# Altium schematic sheet 栅驱-逆变-采样.schdoc
size 432 x 297 mm; Symbol: Drawing-Symbol_A4; Company: 嘉立创EDA; Version: V1.0; Page Size: A4; @Project Name: V4.0整合版; @Update Date: 2026-07-27; @Create Date: 2026-07-27; Device: Drawing-Symbol_A4; @Board Name: Board1; @Page Name: P2; @Create Time: 21:21:39; @Page Count: 2; @Page No: 2; @Schematic Name: Schematic1; @Update Time: 21:21:39; @Assembly Variant: Basic; Border: 1; Title Block Position: 3; Size: A4; Width: 1700; Height: 1170; Region Start: 1; X Region Count: 6; Y Region Count: 4; Blade Width: 10; Title Block: 0
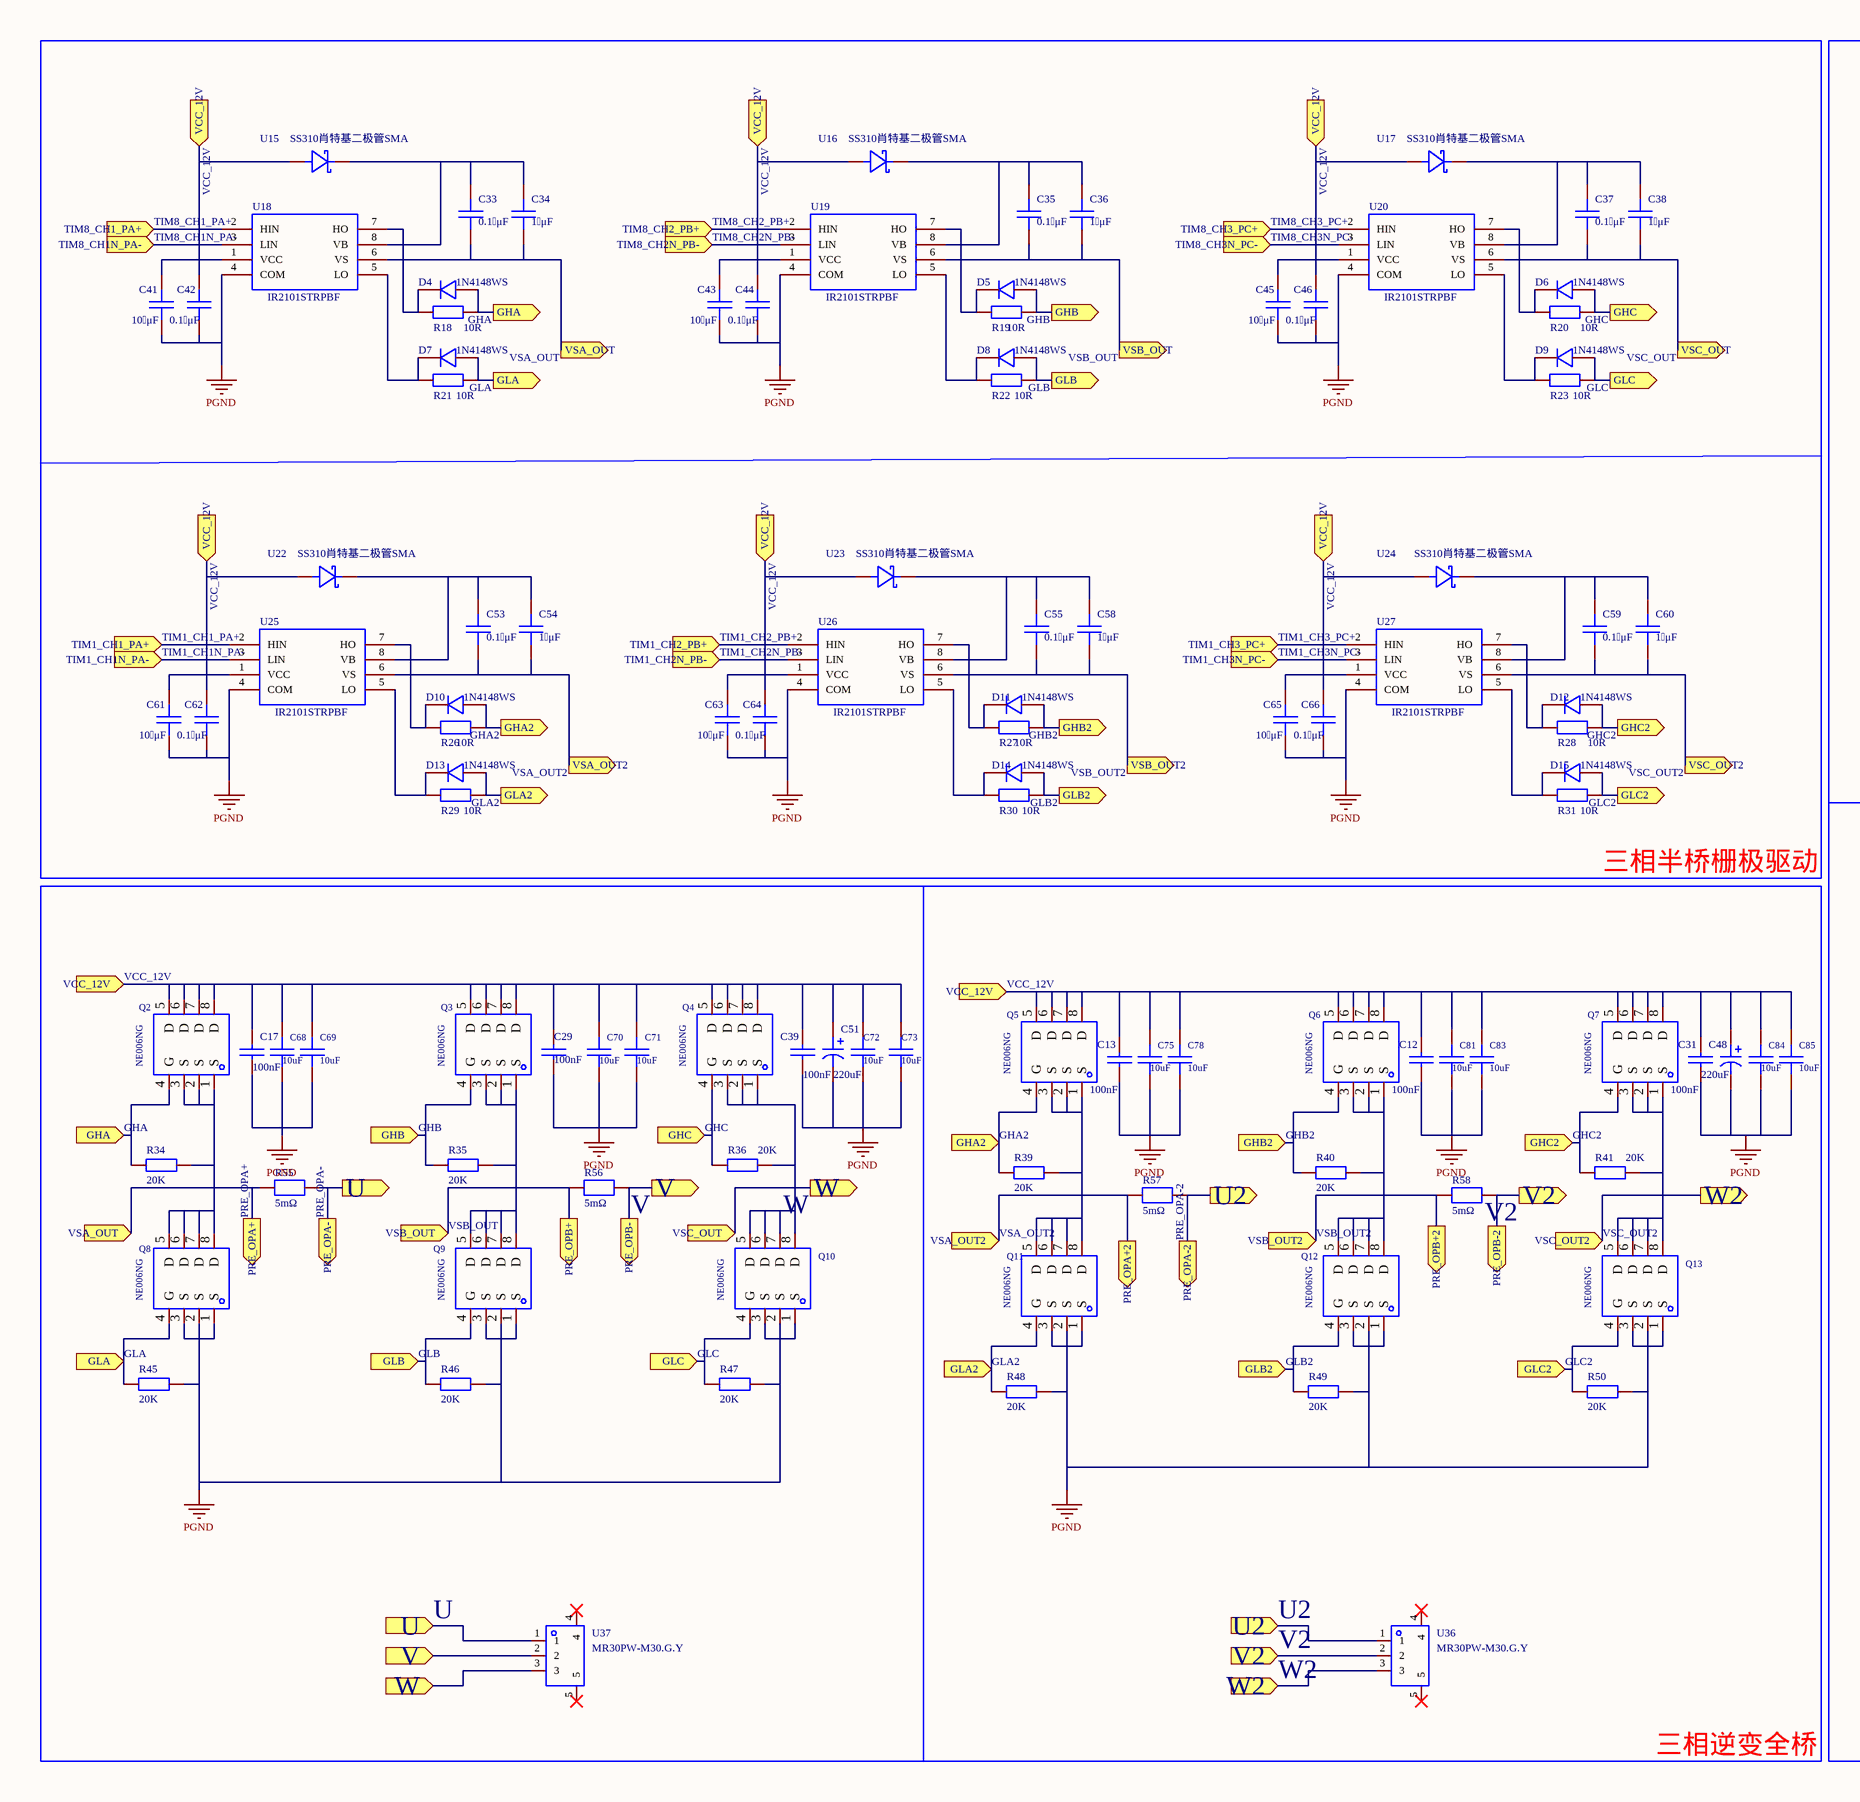
[diagram p0: 栅驱-逆变-采样.schdoc, left]
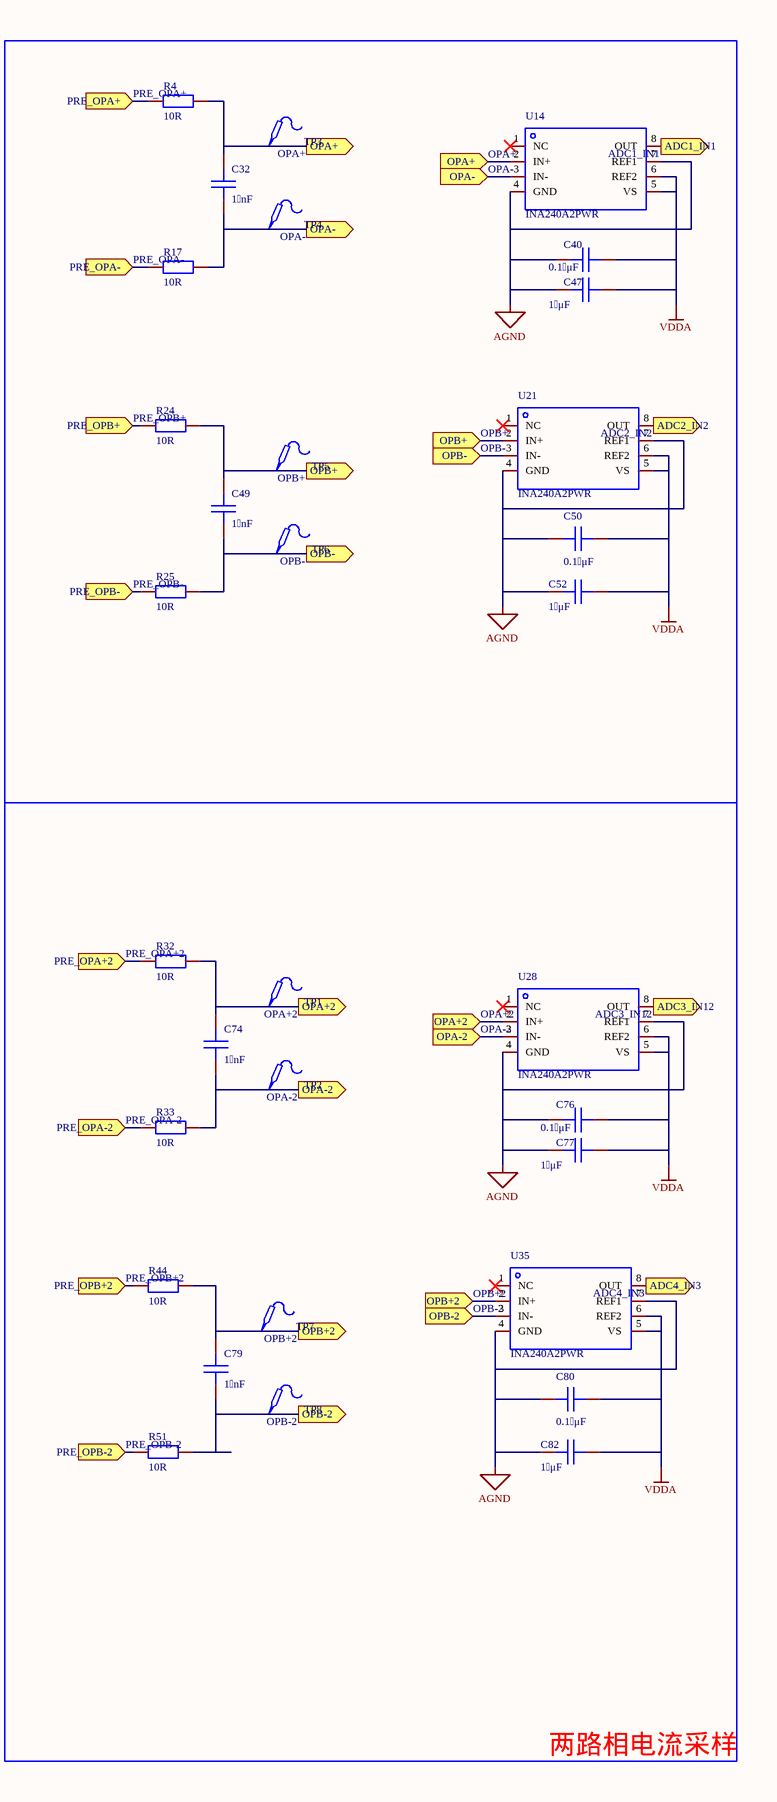
[diagram p1: 栅驱-逆变-采样.schdoc, right]

## Parts
C12  100nF  [C1206]
C13  100nF  [C1206]
C17  100nF  [C1206]
C29  100nF  [C1206]
C31  100nF  [C1206]
C32  1 nF  [C0603]
C33  0.1 μF  [C0603]
C34  1 μF  [C0603]
C35  0.1 μF  [C0603]
C36  1 μF  [C0603]
C37  0.1 μF  [C0603]
C38  1 μF  [C0603]
C39  100nF  [C1206]
C40  0.1 μF  [C0603]
C41  10 μF  [C0603]
C42  0.1 μF  [C0603]
C43  10 μF  [C0603]
C44  0.1 μF  [C0603]
C45  10 μF  [C0603]
C46  0.1 μF  [C0603]
C47  1 μF  [C0603]
C48  220uF  [CAP-SMD_BD6.3-L6.6-W6.6-FD]
C49  1 nF  [C0603]
C50  0.1 μF  [C0603]
C51  220uF  [CAP-SMD_BD6.3-L6.6-W6.6-FD]
C52  1 μF  [C0603]
C53  0.1 μF  [C0603]
C54  1 μF  [C0603]
C55  0.1 μF  [C0603]
C58  1 μF  [C0603]
C59  0.1 μF  [C0603]
C60  1 μF  [C0603]
C61  10 μF  [C0603]
C62  0.1 μF  [C0603]
C63  10 μF  [C0603]
C64  0.1 μF  [C0603]
C65  10 μF  [C0603]
C66  0.1 μF  [C0603]
C68  10uF  [C1206]
C69  10uF  [C1206]
C70  10uF  [C1206]
C71  10uF  [C1206]
C72  10uF  [C1206]
C73  10uF  [C1206]
C74  1 nF  [C0603]
C75  10uF  [C1206]
C76  0.1 μF  [C0603]
C77  1 μF  [C0603]
C78  10uF  [C1206]
C79  1 nF  [C0603]
C80  0.1 μF  [C0603]
C81  10uF  [C1206]
C82  1 μF  [C0603]
C83  10uF  [C1206]
C84  10uF  [C1206]
C85  10uF  [C1206]
D4  1N4148WS  [SOD-323_L1.8-W1.3-LS2.5-RD]
D5  1N4148WS  [SOD-323_L1.8-W1.3-LS2.5-RD]
D6  1N4148WS  [SOD-323_L1.8-W1.3-LS2.5-RD]
D7  1N4148WS  [SOD-323_L1.8-W1.3-LS2.5-RD]
D8  1N4148WS  [SOD-323_L1.8-W1.3-LS2.5-RD]
D9  1N4148WS  [SOD-323_L1.8-W1.3-LS2.5-RD]
D10  1N4148WS  [SOD-323_L1.8-W1.3-LS2.5-RD]
D11  1N4148WS  [SOD-323_L1.8-W1.3-LS2.5-RD]
D12  1N4148WS  [SOD-323_L1.8-W1.3-LS2.5-RD]
D13  1N4148WS  [SOD-323_L1.8-W1.3-LS2.5-RD]
D14  1N4148WS  [SOD-323_L1.8-W1.3-LS2.5-RD]
D15  1N4148WS  [SOD-323_L1.8-W1.3-LS2.5-RD]
Q2  NE006NG  [DFN5X6-8_L5.8-W5.0-P1.27-LS6.2-BL-EP]
Q3  NE006NG  [DFN5X6-8_L5.8-W5.0-P1.27-LS6.2-BL-EP]
Q4  NE006NG  [DFN5X6-8_L5.8-W5.0-P1.27-LS6.2-BL-EP]
Q5  NE006NG  [DFN5X6-8_L5.8-W5.0-P1.27-LS6.2-BL-EP]
Q6  NE006NG  [DFN5X6-8_L5.8-W5.0-P1.27-LS6.2-BL-EP]
Q7  NE006NG  [DFN5X6-8_L5.8-W5.0-P1.27-LS6.2-BL-EP]
Q8  NE006NG  [DFN5X6-8_L5.8-W5.0-P1.27-LS6.2-BL-EP]
Q9  NE006NG  [DFN5X6-8_L5.8-W5.0-P1.27-LS6.2-BL-EP]
Q10  NE006NG  [DFN5X6-8_L5.8-W5.0-P1.27-LS6.2-BL-EP]
Q11  NE006NG  [DFN5X6-8_L5.8-W5.0-P1.27-LS6.2-BL-EP]
Q12  NE006NG  [DFN5X6-8_L5.8-W5.0-P1.27-LS6.2-BL-EP]
Q13  NE006NG  [DFN5X6-8_L5.8-W5.0-P1.27-LS6.2-BL-EP]
R4  10R  [R0603]
R17  10R  [R0603]
R18  10R  [R0603]
R19  10R  [R0603]
R20  10R  [R0603]
R21  10R  [R0603]
R22  10R  [R0603]
R23  10R  [R0603]
R24  10R  [R0603]
R25  10R  [R0603]
R26  10R  [R0603]
R27  10R  [R0603]
R28  10R  [R0603]
R29  10R  [R0603]
R30  10R  [R0603]
R31  10R  [R0603]
R32  10R  [R0603]
R33  10R  [R0603]
R34  20K  [R0603]
R35  20K  [R0603]
R36  20K  [R0603]
R39  20K  [R0603]
R40  20K  [R0603]
R41  20K  [R0603]
R44  10R  [R0603]
R45  20K  [R0603]
R46  20K  [R0603]
R47  20K  [R0603]
R48  20K  [R0603]
R49  20K  [R0603]
R50  20K  [R0603]
R51  10R  [R0603]
R55  5mΩ  [R0612]
R56  5mΩ  [R0612]
R57  5mΩ  [R0612]
R58  5mΩ  [R0612]
TP1  (no value)  [Test-Point-0.5mm]
TP2  (no value)  [Test-Point-0.5mm]
TP3  (no value)  [Test-Point-0.5mm]
TP4  (no value)  [Test-Point-0.5mm]
TP5  (no value)  [Test-Point-0.5mm]
TP6  (no value)  [Test-Point-0.5mm]
TP7  (no value)  [Test-Point-0.5mm]
TP8  (no value)  [Test-Point-0.5mm]
U14  INA240A2PWR  [TSSOP-8_L4.4-W3.0-P0.65-LS6.4-BL]
U15  SS310肖特基二极管SMA  [SMA_L4.3-W2.6-LS5.1-R-RD]
U16  SS310肖特基二极管SMA  [SMA_L4.3-W2.6-LS5.1-R-RD]
U17  SS310肖特基二极管SMA  [SMA_L4.3-W2.6-LS5.1-R-RD]
U18  IR2101STRPBF  [SOIC-8_L5.0-W4.0-P1.27-LS6.0-BL]
U19  IR2101STRPBF  [SOIC-8_L5.0-W4.0-P1.27-LS6.0-BL]
U20  IR2101STRPBF  [SOIC-8_L5.0-W4.0-P1.27-LS6.0-BL]
U21  INA240A2PWR  [TSSOP-8_L4.4-W3.0-P0.65-LS6.4-BL]
U22  SS310肖特基二极管SMA  [SMA_L4.3-W2.6-LS5.1-R-RD]
U23  SS310肖特基二极管SMA  [SMA_L4.3-W2.6-LS5.1-R-RD]
U24  SS310肖特基二极管SMA  [SMA_L4.3-W2.6-LS5.1-R-RD]
U25  IR2101STRPBF  [SOIC-8_L5.0-W4.0-P1.27-LS6.0-BL]
U26  IR2101STRPBF  [SOIC-8_L5.0-W4.0-P1.27-LS6.0-BL]
U27  IR2101STRPBF  [SOIC-8_L5.0-W4.0-P1.27-LS6.0-BL]
U28  INA240A2PWR  [TSSOP-8_L4.4-W3.0-P0.65-LS6.4-BL]
U35  INA240A2PWR  [TSSOP-8_L4.4-W3.0-P0.65-LS6.4-BL]
U36  MR30PW-M30.G.Y  [CONN-TH_MR30PW-M30-G-Y]
U37  MR30PW-M30.G.Y  [CONN-TH_MR30PW-M30-G-Y]

## Blocks framed on the sheet
三相半桥栅极驱动: C33-C38 C41-C46 C53-C55 C58-C66 D4-D15 R18-R23 R26-R31 U15-U20 U22-U27
两路相电流采样: C32 C40 C47 C49 C50 C52 C74 C76 C77 C79 C80 C82 R4 R17 R24 R25 R32 R33 R44 R51 TP1-TP8 U14 U21 U28 U35
三相逆变全桥: C12 C13 C17 C29 C31 C39 C48 C51 C68-C73 C75 C78 C81 C83-C85 Q2-Q13 R34-R36 R39-R41 R45-R50 R55-R58 U36 U37

## Ports
ADC1_IN1 (out), ADC2_IN2 (out), ADC3_IN12 (out), ADC4_IN3 (out), GHA2 (in), GHA2 (out), GHA (in), GHA (out), GHB2 (in), GHB2 (out), GHB (in), GHB (out), GHC2 (in), GHC2 (out), GHC (in), GHC (out), GLA2 (in), GLA2 (out), GLA (in), GLA (out), GLB2 (in), GLB2 (out), GLB (in), GLB (out), GLC2 (in), GLC2 (out), GLC (in), GLC (out), OPA+2 (in), OPA+2 (out), OPA+ (in), OPA+ (out), OPA-2 (in), OPA-2 (out), OPA- (in), OPA- (out), OPB+2 (in), OPB+2 (out), OPB+ (in), OPB+ (out), OPB-2 (in), OPB-2 (out), OPB- (in), OPB- (out), PRE_OPA+2 (in), PRE_OPA+2 (out), PRE_OPA+ (in), PRE_OPA+ (out), PRE_OPA-2 (in), PRE_OPA-2 (out), PRE_OPA- (in), PRE_OPA- (out), PRE_OPB+2 (in), PRE_OPB+2 (out), PRE_OPB+ (in), PRE_OPB+ (out), PRE_OPB-2 (in), PRE_OPB-2 (out), PRE_OPB- (in), PRE_OPB- (out), TIM1_CH1_PA+ (in), TIM1_CH1N_PA- (in), TIM1_CH2_PB+ (in), TIM1_CH2N_PB- (in), TIM1_CH3_PC+ (in), TIM1_CH3N_PC- (in), TIM8_CH1_PA+ (in), TIM8_CH1N_PA- (in), TIM8_CH2_PB+ (in), TIM8_CH2N_PB- (in), TIM8_CH3_PC+ (in), TIM8_CH3N_PC- (in), U2 (in), U2 (out), U (in), U (out), V2 (in), V2 (out), V (in), V (out), VCC_12V (in), VSA_OUT2 (in), VSA_OUT2 (out), VSA_OUT (in), VSA_OUT (out), VSB_OUT2 (in), VSB_OUT2 (out), VSB_OUT (in), VSB_OUT (out), VSC_OUT2 (in), VSC_OUT2 (out), VSC_OUT (in), VSC_OUT (out), W2 (in), W2 (out), W (in), W (out)

## Nets
AGND: C40.2 C47.2 C50.2 C52.2 C76.2 C77.2 C80.2 C82.2 U14.4(GND) U14.7(REF1) U21.4(GND) U21.7(REF1) U28.4(GND) U28.7(REF1) U35.4(GND) U35.7(REF1)
PGND: C12.1 C13.1 C17.1 C29.1 C31.1 C39.1 C41.1 C42.1 C43.1 C44.1 C45.1 C46.1 C48.2 C51.2 C61.1 C62.1 C63.1 C64.1 C65.1 C66.1 C68.1 C69.1 C70.1 C71.1 C72.1 C73.1 C75.1 C78.1 C81.1 C83.1 C84.1 C85.1 Q8.1(S) Q8.2(S) Q8.3(S) Q9.1(S) Q9.2(S) Q9.3(S) Q10.1(S) Q10.2(S) Q10.3(S) Q11.1(S) Q11.2(S) Q11.3(S) Q12.1(S) Q12.2(S) Q12.3(S) Q13.1(S) Q13.2(S) Q13.3(S) R45.1 R46.1 R47.1 R48.1 R49.1 R50.1 U18.4(COM) U19.4(COM) U20.4(COM) U25.4(COM) U26.4(COM) U27.4(COM)
VDDA: C40.1 C47.1 C50.1 C52.1 C76.1 C77.1 C80.1 C82.1 U14.5(VS) U14.6(REF2) U21.5(VS) U21.6(REF2) U28.5(VS) U28.6(REF2) U35.5(VS) U35.6(REF2)
ADC1_IN1: U14.8(OUT) ; port ADC1_IN1
ADC2_IN2: U21.8(OUT) ; port ADC2_IN2
ADC3_IN12: U28.8(OUT) ; port ADC3_IN12
ADC4_IN3: U35.8(OUT) ; port ADC4_IN3
GHA: D4.2(A) Q2.4(G) R18.1 R34.2 ; port GHA
GHA2: D10.2(A) Q5.4(G) R26.1 R39.2 ; port GHA2
GHB: D5.2(A) Q3.4(G) R19.1 R35.2 ; port GHB
GHB2: D11.2(A) Q6.4(G) R27.1 R40.2 ; port GHB2
GHC: D6.2(A) Q4.4(G) R20.1 R36.2 ; port GHC
GHC2: D12.2(A) Q7.4(G) R28.1 R41.2 ; port GHC2
GLA: D7.2(A) Q8.4(G) R21.1 R45.2 ; port GLA
GLA2: D13.2(A) Q11.4(G) R29.1 R48.2 ; port GLA2
GLB: D8.2(A) Q9.4(G) R22.1 R46.2 ; port GLB
GLB2: D14.2(A) Q12.4(G) R30.1 R49.2 ; port GLB2
GLC: D9.2(A) Q10.4(G) R23.1 R47.2 ; port GLC
GLC2: D15.2(A) Q13.4(G) R31.1 R50.2 ; port GLC2
OPA+: C32.2 R4.1 TP3.1 U14.2(IN+) ; port OPA+
OPA+2: C74.2 R32.1 TP1.1 U28.2(IN+) ; port OPA+2
OPA-: C32.1 R17.1 TP4.1 U14.3(IN-) ; port OPA-
OPA-2: C74.1 R33.1 TP2.1 U28.3(IN-) ; port OPA-2
OPB+: C49.2 R24.1 TP5.1 U21.2(IN+) ; port OPB+
OPB+2: C79.2 R44.1 TP7.1 U35.2(IN+) ; port OPB+2
OPB-: C49.1 R25.1 TP6.1 U21.3(IN-) ; port OPB-
OPB-2: C79.1 R51.1 TP8.1 U35.3(IN-) ; port OPB-2
PRE_OPA+: C33.1 C34.1 Q2.1(S) Q2.2(S) Q2.3(S) Q8.5(D) Q8.6(D) Q8.7(D) Q8.8(D) R4.2 R34.1 R55.1 U18.6(VS) ; port VSA_OUT, port PRE_OPA+  [also labelled VSA_OUT]
PRE_OPA+2: C53.1 C54.1 Q5.1(S) Q5.2(S) Q5.3(S) Q11.5(D) Q11.6(D) Q11.7(D) Q11.8(D) R32.2 R39.1 R57.1 U25.6(VS) ; port VSA_OUT2, port PRE_OPA+2  [also labelled VSA_OUT2]
PRE_OPA-: R17.2 R55.2 U37.1 ; port U, port PRE_OPA-  [also labelled U]
PRE_OPA-2: R33.2 R57.2 U36.1 ; port U2, port PRE_OPA-2  [also labelled U2]
PRE_OPB+: C35.1 C36.1 Q3.1(S) Q3.2(S) Q3.3(S) Q9.5(D) Q9.6(D) Q9.7(D) Q9.8(D) R24.2 R35.1 R56.1 U19.6(VS) ; port VSB_OUT, port PRE_OPB+  [also labelled VSB_OUT]
PRE_OPB+2: C55.1 C58.1 Q6.1(S) Q6.2(S) Q6.3(S) Q12.5(D) Q12.6(D) Q12.7(D) Q12.8(D) R40.1 R44.2 R58.1 U26.6(VS) ; port VSB_OUT2, port PRE_OPB+2  [also labelled VSB_OUT2]
PRE_OPB-: R25.2 R56.2 U37.2 ; port V, port PRE_OPB-  [also labelled V]
PRE_OPB-2: R51.2 R58.2 U36.2 ; port V2, port PRE_OPB-2  [also labelled V2]
TIM1_CH1_PA+: U25.2(HIN) ; port TIM1_CH1_PA+
TIM1_CH1N_PA-: U25.3(LIN) ; port TIM1_CH1N_PA-
TIM1_CH2_PB+: U26.2(HIN) ; port TIM1_CH2_PB+
TIM1_CH2N_PB-: U26.3(LIN) ; port TIM1_CH2N_PB-
TIM1_CH3_PC+: U27.2(HIN) ; port TIM1_CH3_PC+
TIM1_CH3N_PC-: U27.3(LIN) ; port TIM1_CH3N_PC-
TIM8_CH1_PA+: U18.2(HIN) ; port TIM8_CH1_PA+
TIM8_CH1N_PA-: U18.3(LIN) ; port TIM8_CH1N_PA-
TIM8_CH2_PB+: U19.2(HIN) ; port TIM8_CH2_PB+
TIM8_CH2N_PB-: U19.3(LIN) ; port TIM8_CH2N_PB-
TIM8_CH3_PC+: U20.2(HIN) ; port TIM8_CH3_PC+
TIM8_CH3N_PC-: U20.3(LIN) ; port TIM8_CH3N_PC-
VCC_12V: C12.2 C13.2 C17.2 C29.2 C31.2 C39.2 C41.2 C42.2 C43.2 C44.2 C45.2 C46.2 C48.1 C51.1 C61.2 C62.2 C63.2 C64.2 C65.2 C66.2 C68.2 C69.2 C70.2 C71.2 C72.2 C73.2 C75.2 C78.2 C81.2 C83.2 C84.2 C85.2 Q2.5(D) Q2.6(D) Q2.7(D) Q2.8(D) Q3.5(D) Q3.6(D) Q3.7(D) Q3.8(D) Q4.5(D) Q4.6(D) Q4.7(D) Q4.8(D) Q5.5(D) Q5.6(D) Q5.7(D) Q5.8(D) Q6.5(D) Q6.6(D) Q6.7(D) Q6.8(D) Q7.5(D) Q7.6(D) Q7.7(D) Q7.8(D) U15.1(A) U16.1(A) U17.1(A) U18.1(VCC) U19.1(VCC) U20.1(VCC) U22.1(A) U23.1(A) U24.1(A) U25.1(VCC) U26.1(VCC) U27.1(VCC) ; port VCC_12V
VSC_OUT: C37.1 C38.1 Q4.1(S) Q4.2(S) Q4.3(S) Q10.5(D) Q10.6(D) Q10.7(D) Q10.8(D) R36.1 U20.6(VS) U37.3 ; port VSC_OUT, port W  [also labelled W]
VSC_OUT2: C59.1 C60.1 Q7.1(S) Q7.2(S) Q7.3(S) Q13.5(D) Q13.6(D) Q13.7(D) Q13.8(D) R41.1 U27.6(VS) U36.3 ; port VSC_OUT2, port W2  [also labelled W2]
NetC33_2: C33.2 C34.2 U15.2(K) U18.8(VB)
NetC35_2: C35.2 C36.2 U16.2(K) U19.8(VB)
NetC37_2: C37.2 C38.2 U17.2(K) U20.8(VB)
NetC53_2: C53.2 C54.2 U22.2(K) U25.8(VB)
NetC55_2: C55.2 C58.2 U23.2(K) U26.8(VB)
NetC59_2: C59.2 C60.2 U24.2(K) U27.8(VB)
NetD4_1: D4.1(K) R18.2 U18.7(HO)
NetD5_1: D5.1(K) R19.2 U19.7(HO)
NetD6_1: D6.1(K) R20.2 U20.7(HO)
NetD7_1: D7.1(K) R21.2 U18.5(LO)
NetD8_1: D8.1(K) R22.2 U19.5(LO)
NetD9_1: D9.1(K) R23.2 U20.5(LO)
NetD10_1: D10.1(K) R26.2 U25.7(HO)
NetD11_1: D11.1(K) R27.2 U26.7(HO)
NetD12_1: D12.1(K) R28.2 U27.7(HO)
NetD13_1: D13.1(K) R29.2 U25.5(LO)
NetD14_1: D14.1(K) R30.2 U26.5(LO)
NetD15_1: D15.1(K) R31.2 U27.5(LO)

Not connected (* = marked no-connect by the designer): U14 1(NC)*; U21 1(NC)*; U28 1(NC)*; U35 1(NC)*; U36 4* 5*; U37 4* 5*

## Notes on the sheet
- 创建日期
- 2026-07-27
- 原理图
- 板子
- Schematic1
- Board1
- 更新日期
- 图页
- P2
- 绘制
- 审阅
- V4.0整合版
- 版本
- V1.0
- 尺寸
- A4
- 页    2    共    2
- 嘉立创EDA

## Library data of the parts
C12 C13 C17 C29 C31 C39 = CL31B104KBCNNNC: 容值:100nF;精度:±10%;额定电压:50V;温度系数:X7R;; Manufacturer: SAMSUNG(三星); AddInBom: yes; ModelId: e4be705b945545a48e666415e3682bd80819f05c4eef4c71ace90d822a990e87; ModelName: C1206_L3.2-W1.6-H1.3; ModelTransform: 125.984,62.992,0,0,0,0,0,0,0; Tolerance: ±10%; Voltage Rating: 50V; Temperature Coefficient: X7R; Symbol: CL31B104KBCNNNC; Device: CL31B104KBCNNNC; LCSC Part Name: 100nF ±10% 50V; SupplierPart: C24497; ManufacturerPart: CL31B104KBCNNNC; Supplier Footprint: 1206; JLCPCB Part Class: Basic Part; Datasheet: https://item.szlcsc.com/datasheet/CL31B104KBCNNNC/25237.html; Supplier: LCSC; ConvertToPcb: yes; FootprintName: C1206; Value: 100nF
C32-C38 C40-C47 C49 C50 C52-C55 C58-C66 C74 C76 C77 C79 C80 C82 = CAP_0603: Symbol: Capacitance; 3D Model: ac125912035d415993ca9572d50418b10819f05c4eef4c71ace90d822a990e87; 3D Model Transform: 62.992,31.496,0,0,0,0,0,0,0; ConvertToPcb: yes; ModelName: C0603_L1.6-W0.8-H0.8; Device: CAP_0603; Supplier Footprint: 0603; AddInBom: yes; FootprintName: C0603
  C32 C49 C74 C79: Value: 1 nF
  C33 C35 C37 C40 C42 C44 C46 C50 C53 C55 C59 C62 C64 C66 C76 C80: Value: 0.1 μF
  C34 C36 C38 C47 C52 C54 C58 C60 C77 C82: Value: 1 μF
  C41 C43 C45 C61 C63 C65: Value: 10 μF
C48 C51 = JVJ35V220M6x8: 容值:220uF;精度:±20%;额定电压:35V;纹波电流:190mA@120Hz;; Manufacturer: JIERR(捷而瑞); AddInBom: yes; ModelId: ec7f1c7bda5e4386b54ec5ff3d1d94ff0819f05c4eef4c71ace90d822a990e87; ModelTransform: 307.086,259.842,0,180,0,0,0,0,0; Tolerance: ±20%; Voltage Rating: 35V; Lifetime: 2000hrs@105℃; Symbol: JVJ35V220M6X8; Device: JVJ35V220M6x8; LCSC Part Name: 220uF ±20% 35V; SupplierPart: C46550411; ManufacturerPart: JVJ35V220M6x8; Supplier Footprint: SMD,D6.3xL7.7mm; JLCPCB Part Class: Extended Part; Datasheet: https://item.szlcsc.com/datasheet/JVJ35V220M6x8/48680105.html; Supplier: LCSC; ConvertToPcb: yes; FootprintName: CAP-SMD_BD6.3-L6.6-W6.6-FD; ModelName: CAP-SMD_BD6.3-L6.6-W6.6-FD; Value: 220uF; Ripple Current: 190mA@120Hz; Diameter: 6.3mm; Height - Seated (Max): 7.7mm; Operating Temperature: -55℃~+105℃
C68-C73 C75 C78 C81 C83-C85 = HGC1206R5106M500NSPJ: 容值:10uF;精度:±20%;额定电压:50V;温度系数:X5R;; Manufacturer: Chinocera(华瓷); AddInBom: yes; ModelId: e4be705b945545a48e666415e3682bd80819f05c4eef4c71ace90d822a990e87; ModelName: C1206_L3.2-W1.6-H1.3; ModelTransform: 125.984,62.992,0,0,0,0,0,0,0; Tolerance: ±20%; Voltage Rating: 50V; Temperature Coefficient: X5R; Symbol: HGC1206R5106M500NSPJ; Device: HGC1206R5106M500NSPJ; LCSC Part Name: 10uF ±20% 50V; SupplierPart: C7432782; ManufacturerPart: HGC1206R5106M500NSPJ; Supplier Footprint: 1206; JLCPCB Part Class: Extended Part; Datasheet: https://item.szlcsc.com/datasheet/HGC1206R5106M500NSPJ/8438264.html; Supplier: LCSC; ConvertToPcb: yes; FootprintName: C1206; Value: 10uF
D4-D15 = 1N4148WS_C2128: 二极管配置:独立式;整流电流:150mA;直流反向耐压(Vr):100V;正向压降(Vf):1.25V@150mA;反向恢复时间(Trr):4ns;; Manufacturer: CJ(江苏长电/长晶); Symbol: 1N4148WS T4; 3D Model: db63db13d9e342eb939127d413d6200b0819f05c4eef4c71ace90d822a990e87; 3D Model Transform: 104.3305,51.181,0,0,0,0,0,-0.004,0; Diode Configuration: 独立式; Pd - Power Dissipation: 200mW; Current - Rectified: 150mA; Voltage - DC Reverse(Vr): 100V; Non-Repetitive Peak Forward Surge Current: 2A; Reverse Leakage Current (Ir): 1uA@75V; Reverse Recovery Time (trr): 4ns; AddInBom: yes; Device: 1N4148WS_C2128; LCSC Part Name: 丝印T4 100V 150mA; Supplier Part: C2128; Manufacturer Part: 1N4148WS; Supplier Footprint: SOD-323; JLCPCB Part Class: Basic Part; Datasheet: https://item.szlcsc.com/datasheet/1N4148WS/2485.html; Supplier: LCSC; Voltage - Forward(Vf@If): 1.25V@150mA; Operating Junction Temperature Range: -; ConvertToPcb: yes; FootprintName: SOD-323_L1.8-W1.3-LS2.5-RD; ModelName: SOD-323_L1.8-W1.3-LS2.5-RD
Q2-Q13 = NE006NG: 数量:1个N沟道;漏源电压(Vdss):60V;连续漏极电流(Id):70A;导通电阻(RDS(on)):4.6mΩ@10V;耗散功率(Pd):84W;阈值电压(Vgs(th)):2.7V;; Manufacturer: DOINGTER(杜因特); 3D Model: 82d86f10988147ef9b82700d9bd42f650819f05c4eef4c71ace90d822a990e87; 3D Model Transform: 200.787,239.17275,0,0,0,0,0.002,-0.004,0; Number: 1个N沟道; Drain to Source Voltage: 60V; Current - Continuous Drain(Id): 70A; Pd - Power Dissipation: 84W; Gate Threshold Voltage (Vgs(th)): 2.7V; Gate Charge(Qg): 90nC@10V; Input Capacitance(Ciss): 4nF; Reverse Transfer Capacitance (Crss@Vds): 252pF; Type: N沟道; Output Capacitance(Coss): 309pF; AddInBom: yes; Symbol: NE006NG; Device: NE006NG; LCSC Part Name: N沟道MOSFET采用先进沟槽技术，具备低栅极电荷和出色散热性能; Supplier Part: C54157801; Manufacturer Part: NE006NG; Supplier Footprint: DFN-8(5x6); JLCPCB Part Class: Extended Part; Datasheet: https://item.szlcsc.com/datasheet/NE006NG/57396370.html; Supplier: LCSC; RDS(on): 4.6mΩ@10V; Operating Temperature: -50℃~+150℃; ConvertToPcb: yes; FootprintName: DFN5X6-8_L5.8-W5.0-P1.27-LS6.2-BL-EP; ModelName: DFN5X6-8_L5.8-W5.0-P1.27-LS6.2-BL-EP
R4 R17-R36 R39-R41 R44-R51 = Res_0603: Symbol: 电阻; 3D Model: fc143cca1e79419f9cd78b61e9279f080819f05c4eef4c71ace90d822a990e87; 3D Model Transform: 31.8897,63.7794,0,90,0,0,0,0,0; ConvertToPcb: yes; Device: Res_0603; Supplier Footprint: 0603; AddInBom: yes; FootprintName: R0603; ModelName: R0603
  R4 R17-R33 R44 R51: Value: 10R
  R34-R36 R39-R41 R45-R50: Value: 20K
R55-R58 = MLR06A1R005F2: 电阻类型:合金电阻;阻值:5mΩ;精度:±1%;功率:1W;温度系数:±50ppm/℃;安装方式:贴片;; Manufacturer: prosemi(普罗森美); AddInBom: yes; ModelId: f1de2025d8034c8f979ea2bb0fb44f5c0819f05c4eef4c71ace90d822a990e87; ModelTransform: 62.992,125.984,0,0,0,0,0,0,0; Tolerance: ±1%; Power(Watts): 1W; Symbol: MLR06A1R005F2; Device: MLR06A1R005F2; LCSC Part Name: 5mΩ ±1% 1W; SupplierPart: C21261109; ManufacturerPart: MLR06A1R005F2; Supplier Footprint: 0612; JLCPCB Part Class: Extended Part; Datasheet: https://item.szlcsc.com/datasheet/MLR06A1R005F2/22679766.html; Supplier: LCSC; ConvertToPcb: yes; FootprintName: R0612; ModelName: R0612; Type: 合金电阻; Value: 5mΩ; Temperature Coefficient: ±50ppm/℃; Mounting Type: 贴片
TP1-TP8 = Test-Point: Test Point 测试点; AddInBom: yes; Symbol: Test-Point; Device: Test-Point; ConvertToPcb: yes; FootprintName: Test-Point-0.5mm
U14 U21 U28 U35 = INA240A2PWR: 放大器数:单路;共模电压:-4V~80V;增益:50V/V;带宽:400kHz;; Manufacturer: TI(德州仪器); 3D Model: 85577802f9634e7e85ffa2fd25a37b6f0819f05c4eef4c71ace90d822a990e87; 3D Model Transform: 118.11,251.968,0,0,0,0,0,0,0; Number of Channels: 单路; Gain: 50V/V; Bandwidth: 400kHz; Ib - Input Bias Current: 90uA; Vos - Input Offset Voltage: 5uV; Differential Voltage: -80V~+80V; Single Supply: 2.7V~5.5V; Quiescent Current: 1.8mA; Input Offset Voltage Drift(Vos TC): 250nV/℃; Slew Rate: 2V/us; Common Mode Rejection Ratio (CMRR): 132dB; Noise density(eN): 40nV/√Hz@1kHz; AddInBom: yes; ModelName: TSSOP-8_L4.4-W3.0-P0.65-LS6.4-BL-2; Symbol: INA240A2PWR; Device: INA240A2PWR; LCSC Part Name: 具有增强型PWM抑制功能的高侧和低侧双向零漂移电流感测放大器; Supplier Part: C129949; Manufacturer Part: INA240A2PWR; Supplier Footprint: TSSOP-8; JLCPCB Part Class: Extended Part; Datasheet: https://www.ti.com/cn/lit/gpn/ina240; Supplier: LCSC; Vcm - Common Mode Voltage: -4V~80V; Operating Temperature: -40℃~+125℃; Maximum Power Supply Range (Vdd-Vss): -; Dual Supply: -; Output Current: -; Input Offset Current(Ios): -; Input Offset Current Drift (Ios TC): -; ConvertToPcb: yes; FootprintName: TSSOP-8_L4.4-W3.0-P0.65-LS6.4-BL
U15-U17 U22-U24 = SS310肖特基二极管SMA: 3D Model: 6890bb9641474820a71fce2135ca3aaa0819f05c4eef4c71ace90d822a990e87; 3D Model Transform: 194.8815,98.425,0,0,0,0,0,0,0; AddInBom: yes; Symbol: SS310肖特基二极管SMA; Device: SS310肖特基二极管SMA; LCSC Part Name: SS310肖特基二极管SMA; Supplier Part: C9900014981; Manufacturer Part: SS310肖特基二极管SMA; Supplier Footprint: SS310SMA110V; JLCPCB Part Class: Extended Part; Supplier: LCSC; ConvertToPcb: yes; FootprintName: SMA_L4.3-W2.6-LS5.1-R-RD; ModelName: SMA_L4.3-W2.6-LS5.1-R-RD
U18-U20 U25-U27 = IR2101STRPBF: 驱动配置:半桥;负载类型:IGBT；MOSFET;驱动通道数:2;灌电流(IOL):270mA;拉电流(IOH):130mA;工作电压:10V~20V;上升时间(tr):100ns;下降时间(tf):50ns;; Manufacturer: Infineon(英飞凌); 3D Model: 7abc64c95a1a4a04a4ef38f9097c870b0819f05c4eef4c71ace90d822a990e87; 3D Model Transform: 192.913,236.22,0,0,0,0,0,0,0; Driven Configuration: 半桥; Number of Drivers: 2; Current - Output Low(IOL): 270mA; Current - Output High(IOH): 130mA; Rise Time: 100ns; Fall Time: 50ns; Propagation Delay tpLH: 160ns; Propagation Delay tpHL: 150ns; Quiescent Current(Iq): 150uA; AddInBom: yes; Symbol: IR2101STRPBF; Device: IR2101STRPBF; LCSC Part Name: 高低侧驱动器; Supplier Part: C2956; Manufacturer Part: IR2101STRPBF; Supplier Footprint: SOIC-8; JLCPCB Part Class: Extended Part; Datasheet: https://item.szlcsc.com/datasheet/IR2101STRPBF/3338.html; Supplier: LCSC; Load Type: IGBT；MOSFET; Voltage - Supply: 10V~20V; Features: 交错导通保护; Operating Temperature: -40℃~+150℃; Input Logic Level - High: -; Input Logic Level - Low: -; ConvertToPcb: yes; FootprintName: SOIC-8_L5.0-W4.0-P1.27-LS6.0-BL; ModelName: SOIC-8_L5.0-W4.0-P1.27-LS6.0-BL
U36 U37 = MR30PW-M30.G.Y: Manufacturer: AMASS(艾迈斯); AddInBom: yes; ModelId: e8638a615c594f11ac0319766163e5d90819f05c4eef4c71ace90d822a990e87; ModelTransform: 606.298,549.197,0,0,0,0,0,-39.37,-78.74; Symbol: MR30PW-M30.G.Y; Device: MR30PW-M30.G.Y; LCSC Part Name: AMASS(艾迈斯)三芯动力电池马达电调航模插头连接器 弯插公头 金黄H=3mm MR30PW-M30.G.Y; SupplierPart: C19268036; ManufacturerPart: MR30PW-M30.G.Y; Supplier Footprint: -; JLCPCB Part Class: Extended Part; Datasheet: https://item.szlcsc.com/datasheet/MR30PW-M30.G.Y/20526047.html; Supplier: LCSC; ConvertToPcb: yes; FootprintName: CONN-TH_MR30PW-M30-G-Y; ModelName: CONN-TH_MR30PW-M30-G-Y